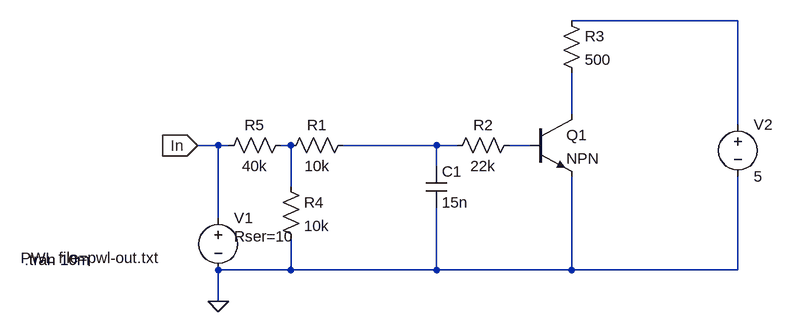
[diagram p0: schematic Filter1.asc]
Filter1.asc, the LTspice schematic file:
Version 4
SHEET 1 1288 680
WIRE 784 -656 528 -656
WIRE 528 -512 528 -576
WIRE 784 -496 784 -656
WIRE -16 -464 -48 -464
WIRE 0 -464 -16 -464
WIRE 96 -464 80 -464
WIRE 320 -464 176 -464
WIRE 352 -464 320 -464
WIRE 464 -464 432 -464
WIRE 320 -432 320 -464
WIRE 96 -400 96 -464
WIRE -16 -352 -16 -464
WIRE 96 -272 96 -320
WIRE 96 -272 -16 -272
WIRE 320 -272 320 -368
WIRE 320 -272 96 -272
WIRE 528 -272 528 -416
WIRE 528 -272 320 -272
WIRE 784 -272 784 -416
WIRE 784 -272 528 -272
WIRE -16 -224 -16 -272
FLAG -16 -224 0
FLAG -48 -464 In
IOPIN -48 -464 In
SYMBOL voltage -16 -368 R0
WINDOW 3 -304 77 Left 2
WINDOW 123 24 44 Left 2
WINDOW 39 24 44 Left 2
SYMATTR InstName V1
SYMATTR Value PWL file=pwl-out.txt
SYMATTR SpiceLine Rser=10
SYMBOL res 192 -480 R90
WINDOW 0 0 56 VBottom 2
WINDOW 3 32 56 VTop 2
SYMATTR InstName R1
SYMATTR Value 10k
SYMATTR SpiceLine tol=5
SYMBOL cap 304 -432 R0
SYMATTR InstName C1
SYMATTR Value 15n
SYMATTR SpiceLine V=25 Irms=728m Rser=0.14361 Lser=0
SYMBOL res 448 -480 R90
WINDOW 0 0 56 VBottom 2
WINDOW 3 32 56 VTop 2
SYMATTR InstName R2
SYMATTR Value 22k
SYMBOL voltage 784 -512 R0
WINDOW 123 0 0 Left 0
WINDOW 39 0 0 Left 0
SYMATTR InstName V2
SYMATTR Value 5
SYMBOL res 512 -672 R0
SYMATTR InstName R3
SYMATTR Value 500
SYMBOL npn 464 -512 R0
SYMATTR InstName Q1
SYMBOL res 80 -416 R0
SYMATTR InstName R4
SYMATTR Value 10k
SYMBOL res 96 -480 R90
WINDOW 0 0 56 VBottom 2
WINDOW 3 32 56 VTop 2
SYMATTR InstName R5
SYMATTR Value 40k
TEXT -314 -288 Left 2 !.tran 10m

The netlist it stands for:
* Filter1.asc
V1 In 0 PWL file=pwl-out.txt Rser=10
R1 N004 N003 10k tol=5
C1 N004 0 15n V=25 Irms=728m Rser=0.14361 Lser=0
R2 N005 N004 22k
V2 N001 0 5
R3 N001 N002 500
Q1 N002 N005 0 0 NPN
R4 N003 0 10k
R5 N003 In 40k
.model NPN NPN
.model PNP PNP
.lib standard.bjt
.tran 10m
.backanno
.end